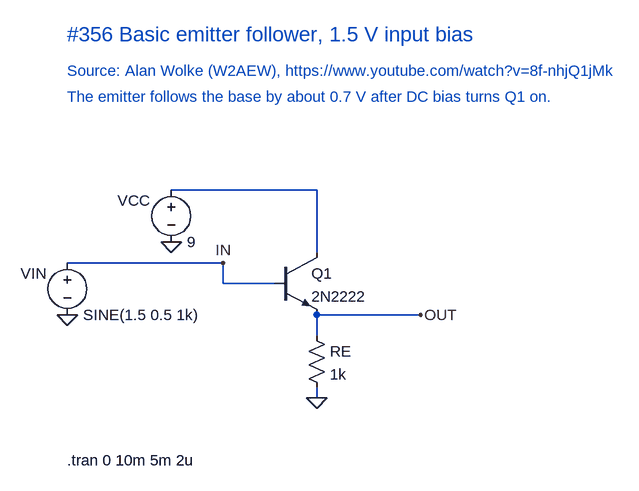
[diagram p0: schematic Basic emitter follower DC biased.asc]
Basic emitter follower DC biased.asc, the LTspice schematic file:
Version 4
SHEET 1 1080 752
WIRE 544 176 320 176
WIRE 544 272 544 176
WIRE 400 288 160 288
WIRE 400 320 400 288
WIRE 480 320 400 320
WIRE 544 400 544 368
WIRE 704 368 544 368
WIRE 544 480 544 496
FLAG 320 256 0
FLAG 160 368 0
FLAG 544 496 0
FLAG 704 368 OUT
FLAG 400 288 IN
SYMBOL voltage 320 160 R0
WINDOW 0 -32 32 Right 2
SYMATTR InstName VCC
SYMATTR Value 9
SYMBOL voltage 160 272 R0
WINDOW 0 -32 32 Right 2
SYMATTR InstName VIN
SYMATTR Value SINE(1.5 0.5 1k)
SYMBOL npn 480 272 R0
SYMATTR InstName Q1
SYMATTR Value 2N2222
SYMBOL res 528 384 R0
SYMATTR InstName RE
SYMATTR Value 1k
TEXT 160 -64 Left 3 ;#356 Basic emitter follower, 1.5 V input bias
TEXT 160 -8 Left 2 ;Source: Alan Wolke (W2AEW), https://www.youtube.com/watch?v=8f-nhjQ1jMk
TEXT 160 32 Left 2 ;The emitter follows the base by about 0.7 V after DC bias turns Q1 on.
TEXT 160 592 Left 2 !.tran 0 10m 5m 2u

The netlist it stands for:
* Basic emitter follower DC biased.asc
VCC N001 0 9
VIN IN 0 SINE(1.5 0.5 1k)
Q1 N001 IN OUT 0 2N2222
RE OUT 0 1k
.model NPN NPN
.model PNP PNP
.lib standard.bjt
* #356 Basic emitter follower, 1.5 V input bias
* Source: Alan Wolke (W2AEW), https://www.youtube.com/watch?v=8f-nhjQ1jMk
* The emitter follows the base by about 0.7 V after DC bias turns Q1 on.
.tran 0 10m 5m 2u
.backanno
.end